# EasyEDA Pro project climbsnail-spotwelder-45c7d2f7.epro, board 大号控制板（部分未绘制）
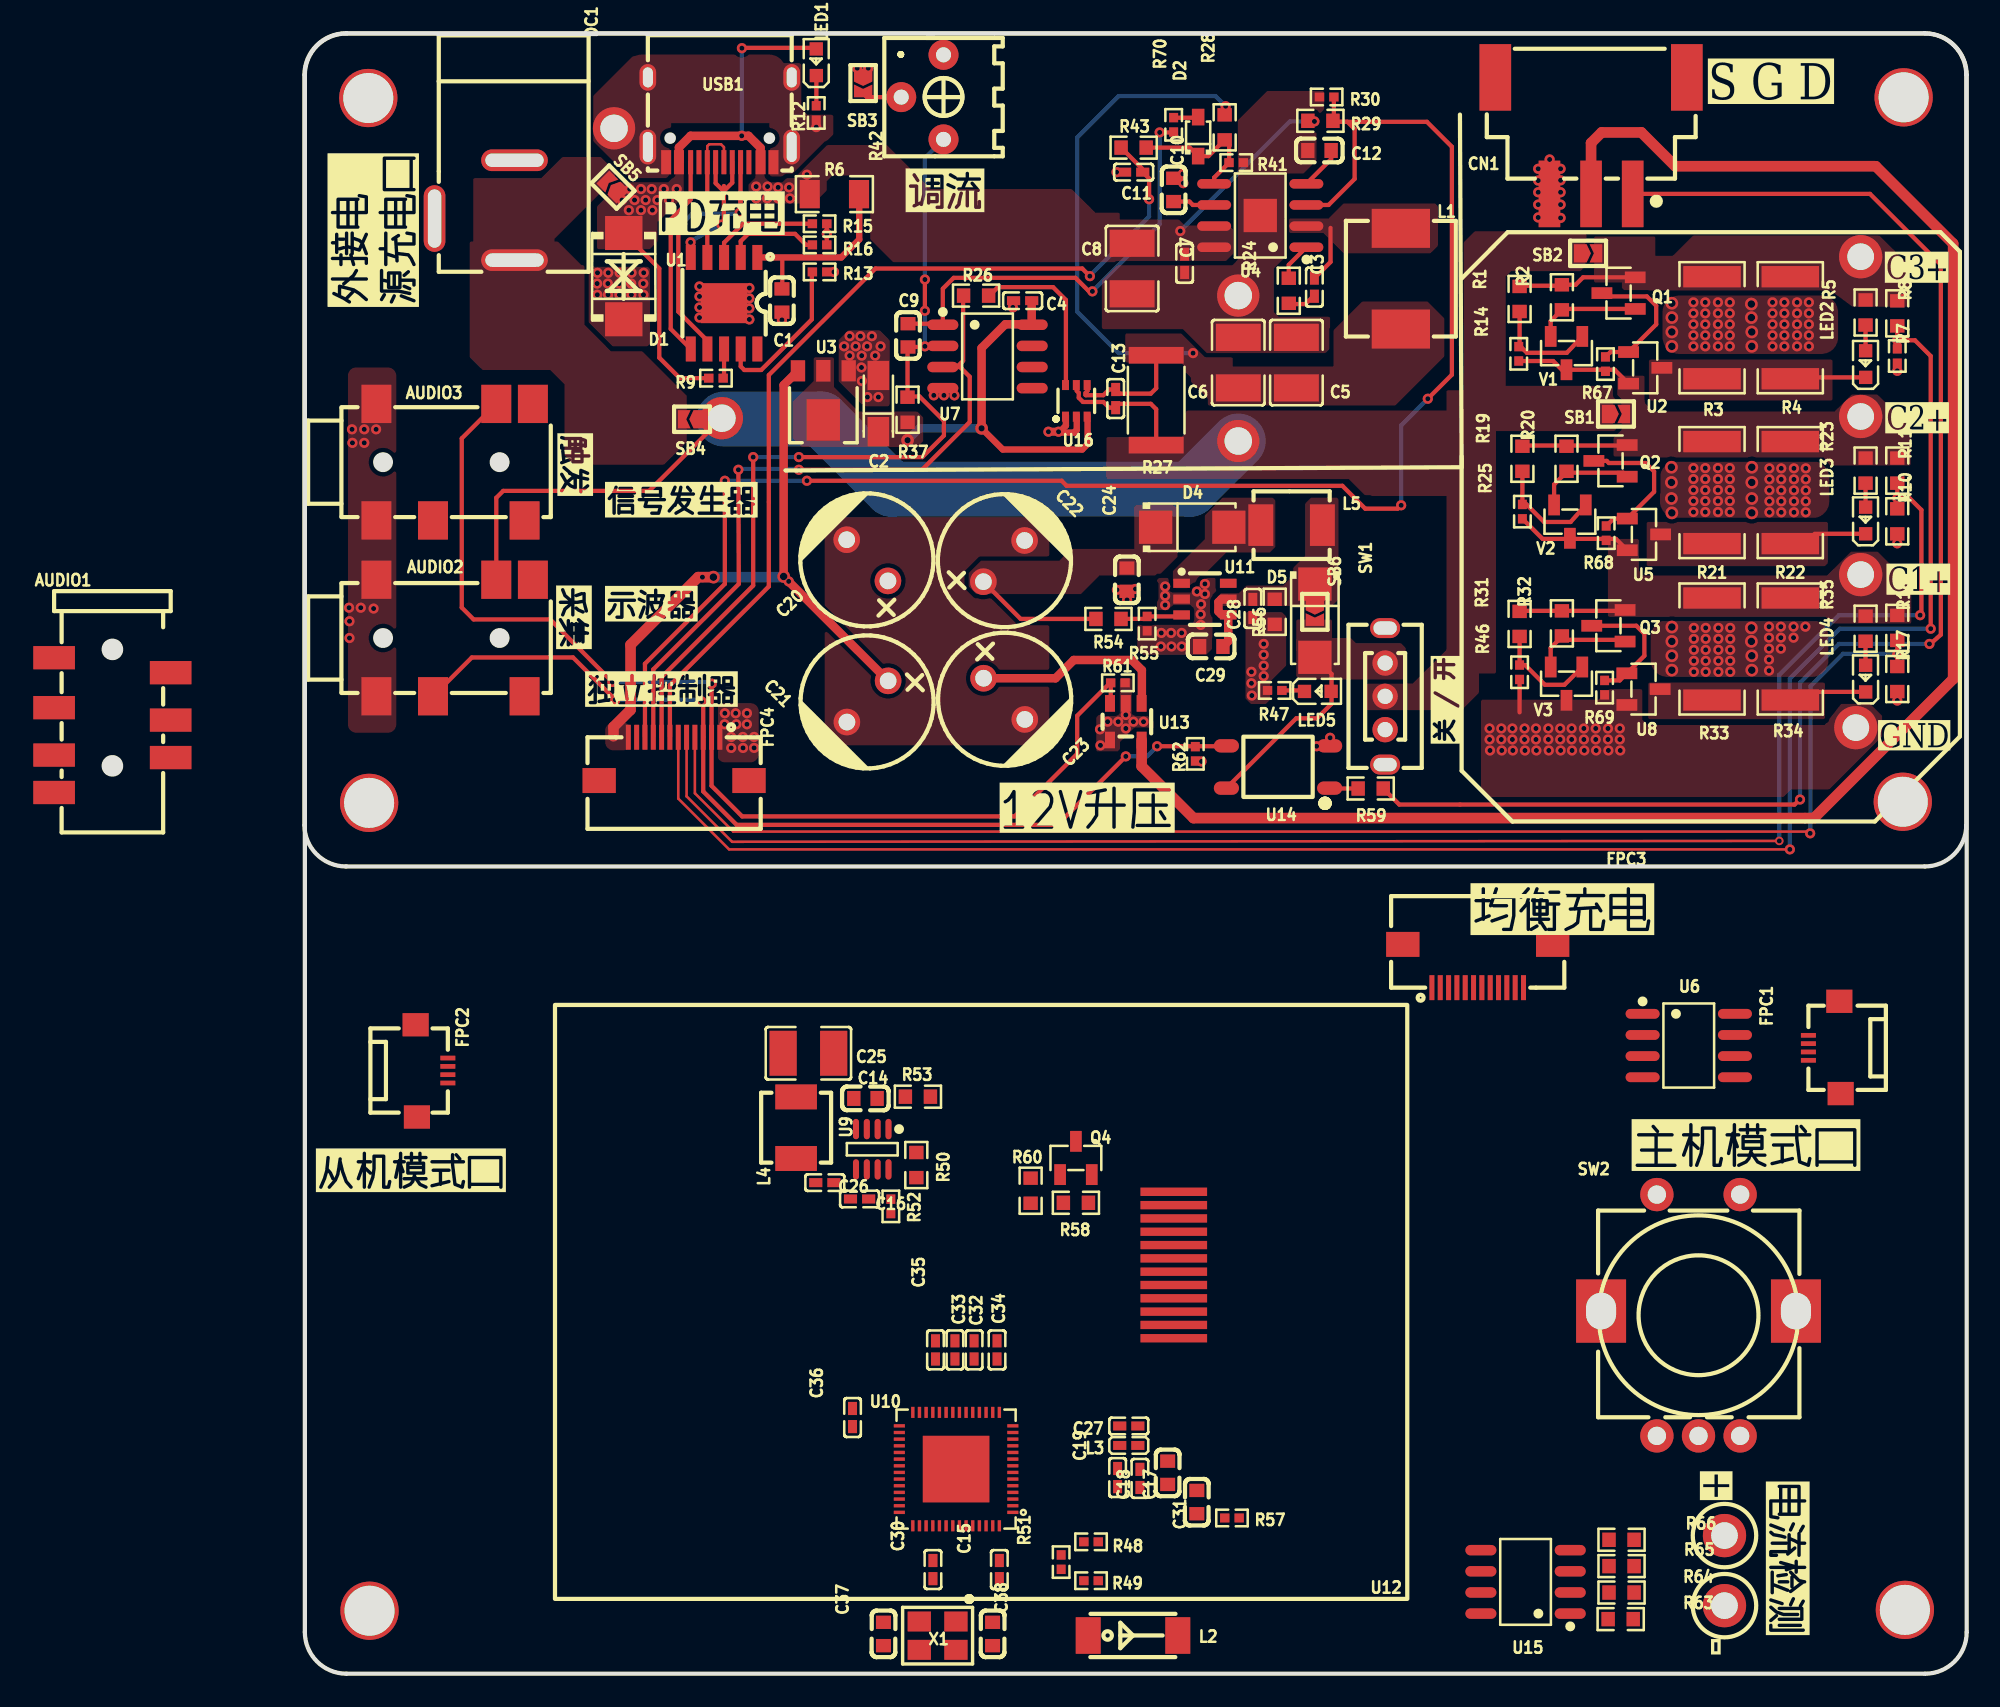
[diagram p16: board, top side]
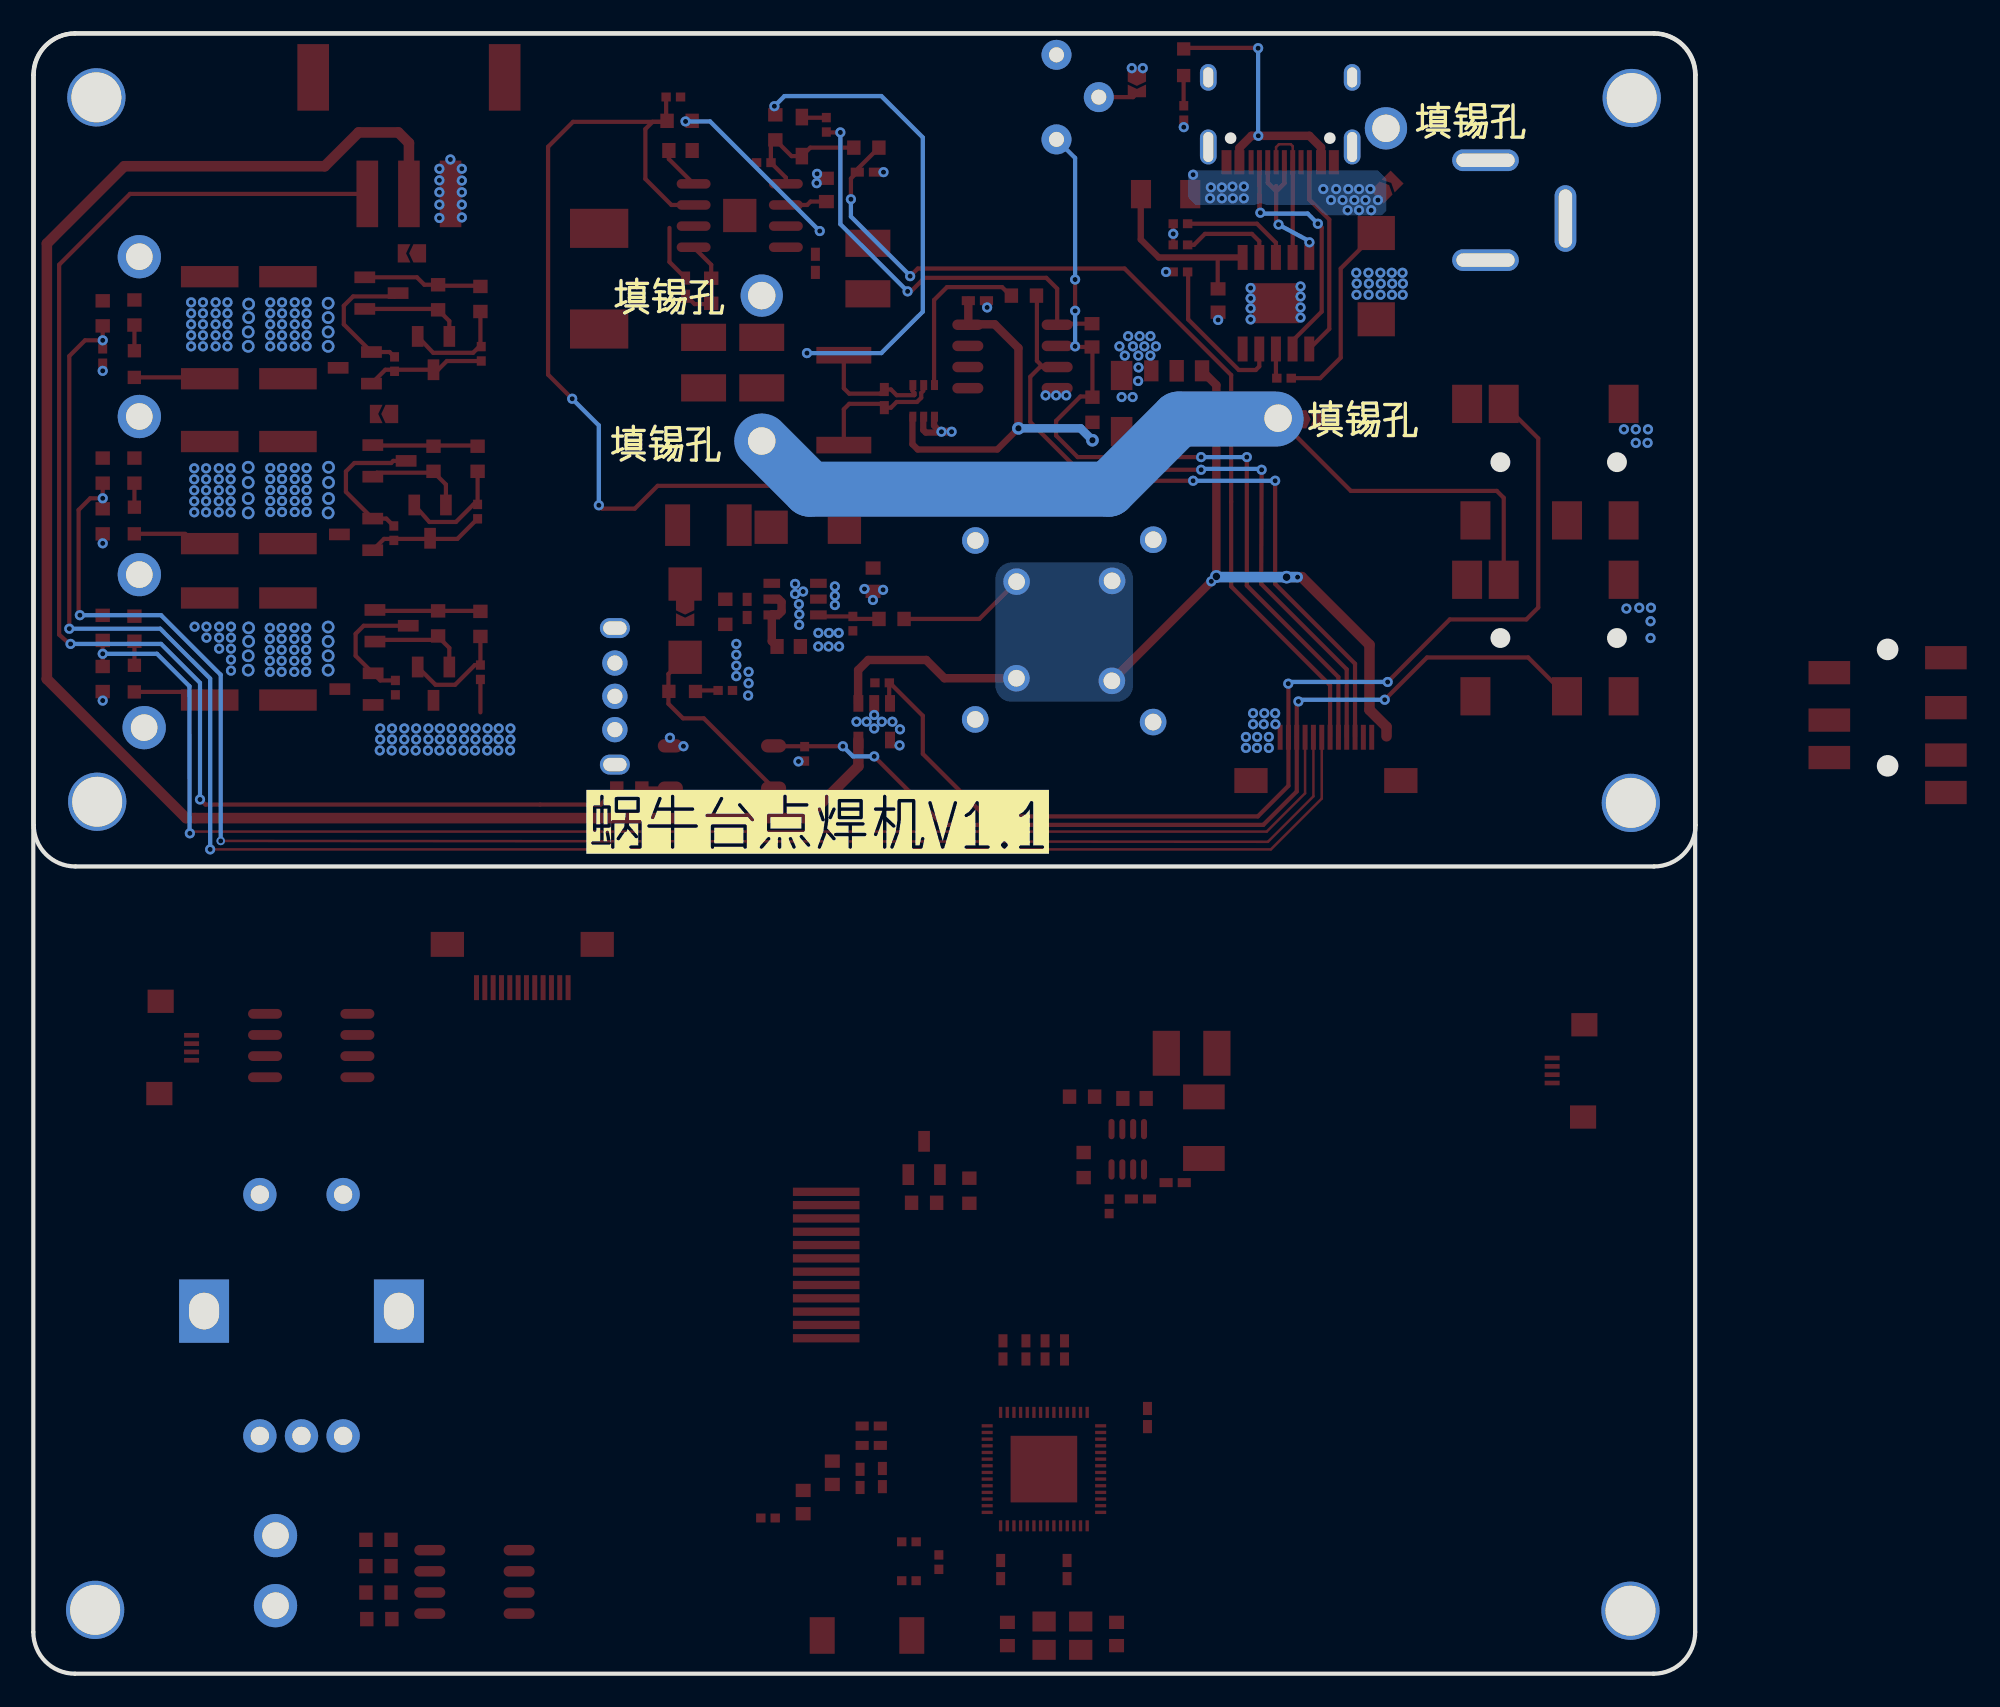
[diagram p17: board, bottom side, seen from below]

Outline 112 x 98.56 mm; copper layers: Top Layer, Bottom Layer. Coordinates in mm from the lower left corner of the outline.
Outline path: 12.18,96.06 12.18,51 arc(12.91,49.24) 14.68,48.5 109.48,48.5 arc(111.25,49.24) 111.98,51 111.98,96.06 arc(111.25,97.83) 109.48,98.56 14.68,98.56 arc(12.91,97.83) 12.18,96.06 ; 12.2,96.05 12.2,2.5 arc(12.94,0.73) 14.7,0 109.5,0 arc(111.27,0.73) 112,2.5 112,96.05 arc(111.27,97.82) 109.5,98.55 14.7,98.55 arc(12.94,97.82) 12.2,96.05
Stack: Top Layer 0.035mm / Dielectric1 1.51mm FR4 er 4.5 / Bottom Layer 0.035mm

## Design rules (mm)
net +CAP: DP1
net $1N37952: DP1
spacing copperThickness1oz (default): track to track 0.102, other pairs 0.152 to 0.3
spacing copperThickness2oz: track to track 0.203, other pairs 0.152 to 0.3
spacing Plane_innerPlane: track to track 0.102, other pairs 0.152 to 0.3
spacing Copper_copperRegion: track to track 0.102, other pairs 0.152 to 0.3
track width copperThickness1oz (default): min 0.127, default 0.254, max 2.54
track width copperThickness2oz: min 0.203, default 0.254, max 2.54
differential pair differentialPair (default): width min 0.127, default 0.254, max 2.54; gap min 0.152, default 0.152
pour e544 uses Copper_copperRegion
pour e546 uses Copper_copperRegion
pour e548 uses Copper_copperRegion
pour e550 uses Copper_copperRegion
pour e552 uses Copper_copperRegion
pour e554 uses Copper_copperRegion
pour e556 uses Copper_copperRegion
pour e558 uses Copper_copperRegion
pour e560 uses Copper_copperRegion
pour e562 uses Copper_copperRegion
pour e564 uses Copper_copperRegion
pour e566 uses Copper_copperRegion
pour e568 uses Copper_copperRegion
pour e570 uses Copper_copperRegion
pour e572 uses Copper_copperRegion
pour e574 uses Copper_copperRegion
pour e576 uses Copper_copperRegion
pour e578 uses Copper_copperRegion
pour e580 uses Copper_copperRegion
pour e582 uses Copper_copperRegion
pour e584 uses Copper_copperRegion
pour e586 uses Copper_copperRegion
pour e588 uses Copper_copperRegion
pour e590 uses Copper_copperRegion
pour e592 uses Copper_copperRegion
pour e594 uses Copper_copperRegion
pour e596 uses Copper_copperRegion
pour e598 uses Copper_copperRegion
pour e600 uses Copper_copperRegion
pour e602 uses Copper_copperRegion
pour e604 uses Copper_copperRegion
pour e606 uses Copper_copperRegion
pour e608 uses Copper_copperRegion
pour e610 uses Copper_copperRegion
pour e612 uses Copper_copperRegion
pour e614 uses Copper_copperRegion
pour e616 uses Copper_copperRegion
pour e618 uses Copper_copperRegion
pour e620 uses Copper_copperRegion
pour e622 uses Copper_copperRegion
pour e623 uses Copper_copperRegion
pour e625 uses Copper_copperRegion
pour e627 uses Copper_copperRegion
pour e629 uses Copper_copperRegion
pour e631 uses Copper_copperRegion
pour e633 uses Copper_copperRegion
pour e635 uses Copper_copperRegion
pour e637 uses Copper_copperRegion

## Placement (name value [footprint] x y rotation side)
AUDIO1  PJ-393-7A  [AUDIO-SMD_PJ-393-7A]  0.65 57 0 top
AUDIO2  PJ-342  [AUDIO-SMD_PJ-3420-A-SMT_C319102]  21.2 62.23 0 top
AUDIO3  PJ-342  [AUDIO-SMD_PJ-3420-A-SMT_C319102]  21.2 72.8 0 top
C1  1uF  [C0603]  40.86 82.51 90 top
C2  10uF  [CAP-SMD-钽_3216]  46.65 76.32 90 top
C3  100nF  [C0402]  72.83 83.31 270 top
C4  100nF  [C0402]  55.31 82.5 180 top
C5  22uF/25V  [C1210]  71.75 78.78 90 top
C6  22uF/25V  [C1210]  68.26 78.78 90 top
C7  100nF  [C0402]  65.04 84.74 90 top
C8  22uF/25V  [C1210]  61.88 84.43 270 top
C9  1uF  [C0603]  48.43 80.42 90 top
C10  1uF  [C0603]  64.38 89.15 270 top
C11  100nF  [C0402]  61.98 90.22 180 top
C12  1uF  [C0603]  73.14 91.52 0 top
C13  100nF  [C0402]  60.9 76.62 90 top
C14  1uF  [C0603]  45.87 34.57 0 top
C15  100nF  [C0402]  53.91 6.26 270 top
C16  100nF  [C0402]  45.52 28.53 180 top
C17  1uF  [C0603]  64.02 12.07 90 top
C18  100nF  [C0402]  62.35 11.73 90 top
C19  100nF  [C0402]  61.01 11.79 90 top
C20  16V470uF  [CAP-TH_BD8.0-P3.50-D0.6-FD_1]  45.98 66.9 135 top
C21  16V470uF  [CAP-TH_BD8.0-P3.50-D0.6-FD_1]  45.99 58.42 225 top
C22  16V470uF  [CAP-TH_BD8.0-P3.50-D0.6-FD_1]  54.19 66.85 45 top
C23  16V470uF  [CAP-TH_BD8.0-P3.50-D0.6-FD_1]  54.2 58.58 315 top
C24  1uF  [C0603]  61.57 65.73 90 top
C25  22uF/25V  [C1210]  42.44 37.28 0 top
C26  100nF  [C0402]  43.43 29.51 180 top
C27  100nF  [C0402]  61.68 14.88 0 top
C28  100nF  [C0402]  69.13 64.01 90 top
C29  1uF  [C0603]  66.64 61.72 0 top
C30  100nF  [C0402]  49.92 6.26 90 top
C31  1uF  [C0603]  65.77 10.31 90 top
C32  100nF  [C0402]  52.39 19.46 90 top
C33  100nF  [C0402]  51.24 19.46 90 top
C34  100nF  [C0402]  53.77 19.46 90 top
C35  100nF  [C0402]  50.08 19.46 270 top
C36  100nF  [C0402]  45.09 15.39 270 top
C37  22pF  [C0603]  46.95 2.39 270 top
C38  22pF  [C0603]  53.5 2.39 270 top
CN1  XH2.54-3P  [CONN-SMD_3P-P2.50-WT]  89.45 92.41 180 top
CN2  5006  [TH_BD3.2-D2.0]  97.46 4.09 90 top
CN3  5006  [TH_BD3.2-D2.0]  97.46 8.3 90 top
D1  SMBJ20CA  [SMB_L4.6-W3.6-LS5.3-BI]  31.36 83.97 270 top
D2  1N4148WS  [SOD-323_L1.8-W1.3-LS2.5-RD]  65.85 92.36 90 top
D4  SS34  [SMA_L4.3-W2.6-LS5.2-RD]  65.49 68.88 0 top
D5  NC/SS34  [SMA_L4.3-W2.6-LS5.2-RD]  72.86 63.27 270 top
DC1  DC-005 2.0  [DC-IN-TH_DC-5520-1]  22.39 87.93 270 top
FPC1  X05A12H04G  [FPC-SMD_4P-P0.50_XKB_X05A12H04G]  103.47 37.63 90 top
FPC2  X05A12H04G  [FPC-SMD_4P-P0.50_XKB_X05A12H04G]  19.82 36.22 270 top
FPC3  XW05200-12  [FPC-SMD_12P-P0.50_XW05200-12]  82.64 42.52 180 top
FPC4  XW05200-12  [FPC-SMD_12P-P0.50_XW05200-12]  34.38 54.97 0 top
L1  4.7uH  [IND-SMD_L7.0-W6.6_MCW-0650-220]  78.02 83.82 90 top
L2  AN2051-245  [ANT2051]  61.94 2.3 0 top
L3  2nH  [L0402]  61.68 13.72 180 top
L4  2.2uH  [IND-SMD_L4.2-W4.2-C133189]  41.71 32.81 270 top
L5  4.7uH  [IND-SMD_L4.5-W4.0-1]  71.46 69.01 180 top
LED1  -  [LED_0603]  42.91 96.88 90 top
LED2  -  [LED_0603]  105.93 78.74 90 top
LED3  -  [LED_0603]  105.93 69.34 90 top
LED4  -  [LED_0603]  105.93 59.84 90 top
LED5  -  [LED_0603]  73.09 59.03 0 top
NOREF  -  [Pad_e378]  30.77 92.85 0 top
NOREF#2  -  [Pad_e367]  108.29 3.84 0 top
NOREF#3  -  [Pad_e366]  16.01 94.67 0 top
NOREF#4  -  [Pad_e377]  68.26 82.8 0 top
NOREF#5  -  [Pad_e368]  108.22 94.72 0 top
NOREF#6  -  [Pad_e365]  16.09 3.78 0 top
NOREF#7  -  [Pad_e376]  37.25 75.44 0 top
NOREF#8  -  [Pad_e371]  105.64 75.54 0 top
NOREF#9  -  [Pad_e370]  105.64 85.14 0 top
NOREF#10  -  [Pad_e375]  68.26 74.07 0 top
NOREF#11  -  [Pad_e372]  105.64 66.04 0 top
NOREF#12  -  [Pad_e373]  105.35 56.84 0 top
NOREF#13  -  [Pad_e369]  16.06 52.32 90 top
NOREF#14  -  [Pad_e374]  108.17 52.39 180 top
Q1  SS8550  [SOT-23-3_L2.9-W1.3-P1.90-LS2.4-BR]  91.1 82.95 0 top
Q2  SS8550  [SOT-23-3_L2.9-W1.3-P1.90-LS2.4-BR]  90.61 72.87 0 top
Q3  SS8550  [SOT-23-3_L2.9-W1.3-P1.90-LS2.4-BR]  90.49 62.97 0 top
Q4  S8050  [SOT-23-3_L2.9-W1.3-P1.90-LS2.4-BR]  58.51 30.99 270 top
R1  500R  [R0603]  85.15 82.6 90 top
R2  200R  [R0603]  87.69 82.7 90 top
R3  10Ω  [R2512]  96.71 80.87 90 top
R4  10Ω  [R2512]  101.41 80.87 90 top
R5  1K  [R0603]  105.93 81.79 90 top
R6  1K  [R1206]  44 88.9 0 top
R7  10K  [R0402]  107.83 79.17 90 top
R8  100K  [R0603]  107.83 81.74 270 top
R9  10K  [R0402]  36.89 77.84 180 top
R10  100K  [R0603]  107.83 69.24 270 top
R11  200K  [R0603]  107.83 72.29 270 top
R12  10K  [R0402]  42.91 93.78 90 top
R13  NC/10K  [R0402]  43.12 84.23 0 top
R14  10K  [R0402]  85.1 79.31 90 top
R15  NC/10K  [R0402]  43.12 87.12 180 top
R16  NC/10K  [R0402]  43.12 85.85 0 top
R17  100K  [R0603]  107.83 59.77 270 top
R18  100K  [R0603]  107.83 62.84 270 top
R19  500R  [R0603]  85.32 73 90 top
R20  200R  [R0603]  87.97 73 90 top
R21  10Ω  [R2512]  96.71 70.97 90 top
R22  10Ω  [R2512]  101.41 70.97 90 top
R23  1K  [R0603]  105.93 72.29 90 top
R24  10R  [R0603]  71.29 83.09 90 top
R25  10K  [R0402]  85.32 69.82 90 top
R26  1K  [R0603]  52.51 82.8 180 top
R27  10mΩ  [R2512#2]  63.33 76.52 270 top
R28  78.7K  [R0603]  67.44 92.91 90 top
R29  100K  [R0603]  73.19 93.3 0 top
R30  10K  [R0402]  73.57 94.74 0 top
R31  500R  [R0603]  85.15 63.08 90 top
R32  200R  [R0603]  87.69 63.11 90 top
R33  10Ω  [R2512]  96.71 61.57 90 top
R34  10Ω  [R2512]  101.41 61.57 90 top
R35  1K  [R0603]  105.93 62.79 90 top
R37  100K  [R0603]  48.4 75.95 90 top
R41  10K  [R0402]  68.13 90.79 180 top
R42  200kΩ  [RES-ADJ-TH_3P-L7.1-W6.9-P2.50-L_3362P]  49.29 94.73 90 top
R43  NC  [R0603]  61.98 91.69 0 top
R46  10K  [R0402]  85.15 60.17 90 top
R47  10K  [R0402]  70.45 59.08 180 top
R48  TBD  [R0402]  59.42 7.92 180 top
R49  TBD  [R0402]  59.42 5.59 180 top
R50  8.87K  [R0603]  48.92 30.56 270 top
R51  0R  [R0402]  57.62 6.71 270 top
R52  40.2K  [R0402]  47.4 28.08 90 top
R53  200K  [R0603]  49.02 34.67 0 top
R54  200K  [R0603]  60.46 63.38 180 top
R55  10K  [R0402]  62.79 63.09 90 top
R56  200K  [R0603]  70.45 63.8 90 top
R57  10K  [R0402]  67.88 9.36 0 top
R58  10R  [R0603]  58.51 28.3 0 top
R59  1K  [R0603]  76.21 53.19 180 top
R60  1K  [R0603]  55.79 29.02 270 top
R61  10K  [R0402]  61.03 59.54 180 top
R62  10K  [R0402]  65.68 55.27 90 top
R63  2K  [R0603]  91.22 3.28 180 top
R64  1K  [R0603]  91.27 4.88 0 top
R65  2K  [R0603]  91.27 6.47 180 top
R66  1K  [R0603]  91.27 8.05 180 top
R67  10K  [R0402]  90.31 78.69 90 top
R68  10K  [R0402]  90.35 68.53 90 top
R69  10K  [R0402]  90.26 59.25 90 top
R70  10K  [R0402]  64.38 93.07 90 top
SB1  短路点小型  [短路点]  91.13 75.69 180 top
SB2  短路点小型  [短路点]  89.46 85.34 180 top
SB3  短路点小型  [短路点]  45.73 95.38 90 top
SB4  短路点小型  [短路点]  35.27 75.37 0 top
SB5  短路点小型  [短路点]  30.57 89.46 315 top
SB6  短路点小型  [短路点]  72.86 63.61 90 top
SW1  SS-12D07-4  [SW-TH_3P-L8.6-W4.5-P2.60]  77.08 58.72 90 top
SW2  EC11S  [SW-TH_EC11S]  95.9 21.54 0 top
U1  -  [ESOP-10_L4.9-W3.9-P1.00-LS6.2-BL-EP]  37.38 82.35 180 top
U2  AO3400  [SOT-23-3_L2.9-W1.3-P1.90-LS2.4-BL-2]  92.7 78.46 270 top
U3  -  [SOT89L]  43.34 76.81 180 top
U4  SY8205FCC  [SOIC-8_L5.0-W4.0-P1.27-LS6.0-BL-EP2.0]  69.58 87.62 90 top
U5  AO3400  [SOT-23-3_L2.9-W1.3-P1.90-LS2.4-BL-2]  92.62 68.45 270 top
U6  π122U31  [SOIC-8_L4.9-W3.9-P1.27-LS6.0-BL]  95.31 37.74 270 top
U7  GS8632-SR / GS8332-SR  [SOP-8_L4.9-W3.9-P1.27-LS6.0-BL]  53.2 79.15 270 top
U8  AO3400  [SOT-23-3_L2.9-W1.3-P1.90-LS2.4-BL-2]  92.59 59.16 270 top
U9  -  [TSOT-23-8_L2.9-W1.6-P0.65-LS2.8-BR]  46.28 31.51 90 top
U10  ESP32-S3FH4R2  [QFN-56_L7.0-W7.0-P0.40-TL-EP4.0]  51.31 12.29 180 top
U11  SX1308  [SOT-23-6_L2.9-W1.6-P0.95-LS2.8-BR]  66.26 64.57 180 top
U12  -  [2.0TFT-FPC12P]  78.41 4.37 90 top
U13  UCC27517DBVT  [SOT-23-5_L2.9-W1.6-P0.95-LS2.8-BR]  61.51 57.2 90 top
U14  CT185GB(T1)  [SOP-4_L4.4-W3.6-P2.54-LS7.0-TL]  70.65 54.48 180 top
U15  GS8332-SR  [SOP-8_L4.9-W3.9-P1.27-LS6.0-BL]  85.51 5.52 90 top
U16  INA199A1DCKR  [SC-70-6_L2.2-W1.3-P0.65-LS2.1-BR]  58.53 76.48 270 top
USB1  TYPEC-304-BCP16  [USB-C-SMD_TYPEC-304-BCP16]  37.12 93.37 180 top
V1  -  [SOT-23-3_L2.9-W1.3-P1.90-LS2.4-BR]  87.97 79.35 90 top
V2  -  [SOT-23-3_L2.9-W1.3-P1.90-LS2.4-BR]  88.18 69.22 90 top
V3  -  [SOT-23-3_L2.9-W1.3-P1.90-LS2.4-BR]  87.97 59.49 90 top
X1  40MHz  [OSC-SMD_4P-L3.2-W2.5-BL_SIT8008BI]  50.2 2.29 180 top

## Footprints (pads in the part's own frame, mm; a bottom-side part is the same pattern mirrored in y, then rotated)
2.0TFT-FPC12P
  rect 0.5x4 smd: 1(24.587,14.021) 2(23.787,14.021) 3(22.987,14.021) 4(22.187,14.021) 5(21.387,14.021) 6(20.587,14.021) 7(19.787,14.021) 8(18.987,14.021) 9(18.187,14.021) 10(17.387,14.021) 11(16.587,14.021) 12(15.787,14.021)
ANT2051
  rect 1.5x2.2 smd: 1(-2.69,0) 2(2.69,0)
AUDIO-SMD_PJ-393-7A
  rect 2.499x1.399 smd: 1(-3.5,4.049) 2(3.5,-1.95) 3(-3.5,-1.801) 4(-3.5,1.049) 5(-3.5,-4.049) 6(3.5,0.299) 7(3.5,3.15)
AUDIO-SMD_PJ-3420-A-SMT_C319102
  rect 1.8x2.3 smd: 1(-4.7,-3.5) 2(-4.7,3.5) 3(-1.3,-3.5) 4(2.5,3.5) 5(4.7,3.5) 6(4.2,-3.5)
C0402
  rect 0.79x0.54 smd: 1(-0.545,0) 2(0.545,0)
C0603
  rect 0.8x0.9 smd: 1(-0.7,0) 2(0.7,0)
C1210
  rect 1.635x2.7 smd: 1(-1.518,0) 2(1.518,0)
CAP-SMD-钽_3216
  rect 1.758x1.296 smd: 1(-1.687,0) 2(1.687,0)
CAP-TH_BD8.0-P3.50-D0.6-FD_1
  round 1.6 hole 1: 1(-1.75,0) 2(1.75,0)
CONN-SMD_3P-P2.50-WT
  rect 1.3x4 smd: 1(-2.499,3.5) 2(0,3.5) 3(2.499,3.5)
  rect 1.9x4 smd: 4(-5.75,-3.5) 5(5.75,-3.5)
DC-IN-TH_DC-5520-1
  oval 4x1.3 hole 3.5x0.8: 2(0.5,-2.4)
  oval 1.3x4 hole 0.8x3.5: 3(-3,2.4) 4(3,2.4)
ESOP-10_L4.9-W3.9-P1.00-LS6.2-BL-EP
  rect 0.6x1.5 smd: 1(-2,-2.75) 2(-1,-2.75) 3(0,-2.75) 4(1,-2.75) 5(2,-2.75) 6(2,2.75) 7(1,2.75) 8(0,2.75) 9(-1,2.75) 10(-2,2.75)
  rect 2.8x2.4 smd: 11(0,0)
FPC-SMD_4P-P0.50_XKB_X05A12H04G
  rect 0.28x0.9 smd: 1(-0.772,0.968) 2(-0.272,0.968) 3(0.228,0.968) 4(0.728,0.968)
  rect 1.4x1.57 smd: 5(-2.772,-0.968) 6(2.772,-0.889)
FPC-SMD_12P-P0.50_XW05200-12
  rect 0.3x1.5 smd: 1(2.75,1.3) 2(2.25,1.3) 3(1.75,1.3) 4(1.25,1.3) 5(0.75,1.3) 6(0.25,1.3) 7(-0.25,1.3) 8(-0.75,1.3) 9(-1.25,1.3) 10(-1.75,1.3) 11(-2.25,1.3) 12(-2.75,1.3)
  rect 2x1.5 smd: 13(-4.5,-1.3) 14(4.5,-1.3)
IND-SMD_L4.2-W4.2-C133189
  rect 1.5x2.5 smd: 1(-1.85,0) 2(1.85,0)
IND-SMD_L4.5-W4.0-1
  rect 1.501x2.499 smd: 1(-1.849,0) 2(1.849,0)
IND-SMD_L7.0-W6.6_MCW-0650-220
  rect 2.349x3.5 smd: 1(-3.025,0) 2(3.025,0)
L0402
  rect 0.79x0.54 smd: 1(-0.545,0) 2(0.545,0)
LED_0603
  rect 0.8x0.8 smd: 1(-0.851,-0.01) 2(0.75,-0.005)
OSC-SMD_4P-L3.2-W2.5-BL_SIT8008BI
  rect 1.399x1.199 smd: 1(-1.1,-0.851) 2(1.1,-0.851) 3(1.1,0.851) 4(-1.1,0.851)
Pad_e365
  round 3.5 hole 3: 1(0,0)
Pad_e366
  round 3.5 hole 3: 1(0,0)
Pad_e367
  round 3.5 hole 3: 1(0,0)
Pad_e368
  round 3.5 hole 3: 1(0,0)
Pad_e369
  round 3.5 hole 3: 1(0,0)
Pad_e370
  round 2.6 hole 1.6: 1(0,0)
Pad_e371
  round 2.6 hole 1.6: 1(0,0)
Pad_e372
  round 2.6 hole 1.6: 1(0,0)
Pad_e373
  round 2.6 hole 1.6: 1(0,0)
Pad_e374
  round 3.5 hole 3: 1(0,0)
Pad_e375
  round 2.54 hole 1.651: 14(0,0)
Pad_e376
  round 2.54 hole 1.651: 14(0,0)
Pad_e377
  round 2.54 hole 1.651: 14(0,0)
Pad_e378
  round 2.54 hole 1.651: 14(0,0)
QFN-56_L7.0-W7.0-P0.40-TL-EP4.0
  rect 0.665x0.2 smd: 1(-3.408,2.6) 2(-3.408,2.2) 3(-3.408,1.8) 4(-3.408,1.4) 5(-3.408,1) 6(-3.408,0.6) 7(-3.408,0.2) 8(-3.408,-0.2) 9(-3.408,-0.6) 10(-3.408,-1) 11(-3.408,-1.4) 12(-3.408,-1.8) 13(-3.408,-2.2) 14(-3.408,-2.6) 29(3.408,-2.6) 30(3.408,-2.2) 31(3.408,-1.8) 32(3.408,-1.4) 33(3.408,-1) 34(3.408,-0.6) 35(3.408,-0.2) 36(3.408,0.2) 37(3.408,0.6) 38(3.408,1) 39(3.408,1.4) 40(3.408,1.8) 41(3.408,2.2) 42(3.408,2.6)
  rect 0.2x0.665 smd: 15(-2.6,-3.408) 16(-2.2,-3.408) 17(-1.8,-3.408) 18(-1.4,-3.408) 19(-1,-3.408) 20(-0.6,-3.408) 21(-0.2,-3.408) 22(0.2,-3.408) 23(0.6,-3.408) 24(1,-3.408) 25(1.4,-3.408) 26(1.8,-3.408) 27(2.2,-3.408) 28(2.6,-3.408) 43(2.6,3.408) 44(2.2,3.408) 45(1.8,3.408) 46(1.4,3.408) 47(1,3.408) 48(0.6,3.408) 49(0.2,3.408) 50(-0.2,3.408) 51(-0.6,3.408) 52(-1,3.408) 53(-1.4,3.408) 54(-1.8,3.408) 55(-2.2,3.408) 56(-2.6,3.408)
  rect 4x4 smd: 57(0,0)
R0402
  rect 0.566x0.54 smd: 1(-0.433,0) 2(0.433,0)
R0603
  rect 0.806x0.864 smd: 1(-0.753,0) 2(0.753,0)
R1206
  rect 1.208x1.701 smd: 1(-1.479,0) 2(1.479,0)
R2512
  rect 1.282x3.456 smd: 1(-3.067,0) 2(3.067,0)
R2512#2
  rect 1x3.3 smd: 1(-2.7,0) 2(2.7,0)
RES-ADJ-TH_3P-L7.1-W6.9-P2.50-L_3362P
  round 1.801 hole 0.899: 1(-2.54,-1.27) 2(0,1.27) 3(2.54,-1.27)
SC-70-6_L2.2-W1.3-P0.65-LS2.1-BR
  rect 0.6x0.42 smd: 1(0.95,-0.65) 2(0.95,0) 3(0.95,0.65) 4(-0.95,0.65) 5(-0.95,0) 6(-0.95,-0.65)
SMA_L4.3-W2.6-LS5.2-RD
  rect 2x2 smd: 1(-2.2,0) 2(2.2,0)
SMB_L4.6-W3.6-LS5.3-BI
  rect 2.047x2.241 smd: 1(-2.591,0) 2(2.591,0)
SOD-323_L1.8-W1.3-LS2.5-RD
  rect 1x0.75 smd: 1(-1.173,0) 2(1.173,0)
SOIC-8_L4.9-W3.9-P1.27-LS6.0-BL
  oval 0.588x2.045 smd: 1(-1.905,-2.772) 2(-0.635,-2.772) 3(0.635,-2.772) 4(1.905,-2.772) 5(1.905,2.772) 6(0.635,2.772) 7(-0.635,2.772) 8(-1.905,2.772)
SOIC-8_L5.0-W4.0-P1.27-LS6.0-BL-EP2.0
  oval 0.574x2.038 smd: 1(-1.905,-2.769) 2(-0.635,-2.769) 3(0.635,-2.769) 4(1.905,-2.769) 5(1.905,2.769) 6(0.635,2.769) 7(-0.635,2.769) 8(-1.905,2.769)
  rect 2x2 smd: 9(0,0)
SOP-4_L4.4-W3.6-P2.54-LS7.0-TL
  oval 1.508x0.8 smd: 1(-3.1,1.27) 2(-3.1,-1.27) 3(3.1,-1.27) 4(3.1,1.27)
SOP-8_L4.9-W3.9-P1.27-LS6.0-BL
  oval 0.63x1.865 smd: 1(-1.905,-2.683) 2(-0.635,-2.683) 3(0.635,-2.683) 4(1.905,-2.683) 5(1.905,2.683) 6(0.635,2.683) 7(-0.635,2.683) 8(-1.905,2.683)
SOT89L
  rect 0.864x1.27 smd: 1(-1.524,-1.475) 3(1.524,-1.475)
  rect 0.864x1.3 smd: 2(0,-1.475)
  rect 2x2.5 smd: 4(0.001,1.475)
SOT-23-3_L2.9-W1.3-P1.90-LS2.4-BL-2
  rect 0.7x1.25 smd: 1(-0.95,-1) 2(0.95,-1) 3(0,1)
SOT-23-3_L2.9-W1.3-P1.90-LS2.4-BR
  rect 1.25x0.7 smd: 1(1,-0.95) 2(1,0.95) 3(-1,0)
SOT-23-5_L2.9-W1.6-P0.95-LS2.8-BR
  rect 1.001x0.6 smd: 1(1.1,-0.95) 2(1.1,0) 3(1.1,0.95) 4(-1.1,0.95) 5(-1.1,-0.95)
SOT-23-6_L2.9-W1.6-P0.95-LS2.8-BR
  rect 1x0.55 smd: 1(1.4,-0.95) 2(1.4,0) 3(1.4,0.95) 4(-1.4,0.95) 5(-1.4,0) 6(-1.4,-0.95)
SW-TH_3P-L8.6-W4.5-P2.60
  round 1.524 hole 0.914: 1(-2,0) 2(0,0) 3(2,0)
  oval 1.2x1.8 hole 0.8x1.4: 4(-4.1,0) 5(4.1,0)
SW-TH_EC11S
  rect 3x3.8 hole 1.8x2.2: 0(-5.85,0.25) 0(5.85,0.25)
  round 2 hole 1.1: A(-2.5,-7.25) B(2.5,-7.25) C(0,-7.25) S1(-2.5,7.25) S2(2.5,7.25)
TH_BD3.2-D2.0
  round 2.6 hole 1.6: 1(0,0)
TSOT-23-8_L2.9-W1.6-P0.65-LS2.8-BR
  oval 1.222x0.363 smd: 1(1.212,-0.976) 2(1.212,-0.325) 3(1.212,0.325) 4(1.212,0.976) 5(-1.212,0.976) 6(-1.212,0.325) 7(-1.212,-0.325) 8(-1.212,-0.976)
USB-C-SMD_TYPEC-304-BCP16
  oval 1.001x2.1 hole 0.6x1.801: 13(-4.321,1.633) 14(4.321,1.633)
  oval 1.001x1.6 hole 0.6x1.199: 15(-4.321,-2.547) 16(4.321,-2.547)
  rect 0.6x1.45 smd: A1B12(-3.226,2.547) A4B9(-2.451,2.547) B1A12(3.22,2.547) B4A9(2.451,2.547)
  rect 0.299x1.45 smd: A5(-1.25,2.547) A6(-0.249,2.547) A7(0.249,2.547) A8(1.25,2.547) B5(1.75,2.547) B6(0.75,2.547) B7(-0.75,2.547) B8(-1.75,2.547)
短路点
  custom 0x0 smd: 1(-0.66,0) 2(1.042,0)

## Nets
As in the schematic, except:
GND: AUDIO1.1 AUDIO2.1 AUDIO2.2 AUDIO3.1 AUDIO3.2 C1.1 C2.2 C4.2 C5.2 C6.2 C7.1 C8.2 C10.1 C11.2 C12.1 C14.1 C15.2 C16.2 C17.1 C18.1 C19.1 C20.2 C21.2 C22.2 C23.2 C24.1 C25.2 C27.1 C28.1 C29.1 C30.1 C31.2 C32.2 C33.2 C34.2 C35.1 C36.1 C37.1 C38.2 CN1.3 D1.2 DC1.3 FPC2.4 FPC3.12 FPC4.1 NOREF.14 NOREF#4.14 NOREF#12.1 Q4.2 R7.1 R10.2 R12.1 R13.2 R15.1 R16.2 R17.2 R30.1 R41.1 R46.1 R47.2 R48.1 R49.1 R50.1 R55.1 R56.1 R61.1 R62.1 R69.1 SB3.2 SW2.C SW2.S2 U1.11 U3.1 U4.9 U6.4 U7.4 U8.2 U9.1 U9.4 U10.57 U11.2 U12.1 U12.5 U12.6 U12.12 U13.2 U13.4 U14.2 U15.4 U16.1 U16.2 USB1.13 USB1.14 USB1.15 USB1.16 USB1.A1B12 USB1.B1A12 V3.3 X1.2 X1.4
+CAP: AUDIO1.2 AUDIO2.4 C13.1 NOREF#7.14 NOREF#10.14 R27.2 SB1.2 SB2.2 SB4.2 SW1.2 U16.5
CAP1: NOREF#11.1 Q3.2 R18.1 R25.1 R31.2 R32.2 R33.2 R34.2 R35.2 R68.1 U5.2 V2.3
CAP2: NOREF#8.1 Q2.2 R11.1 R14.1 R19.2 R20.2 R21.2 R22.2 R23.2 R67.1 SB1.1 U2.2 V1.3
CAP3: NOREF#9.1 Q1.2 R1.2 R2.2 R3.2 R4.2 R5.2 R8.1 SB2.1

Pads without a net: AUDIO1 5 6 7; AUDIO2 5 6; AUDIO3 3 5 6; CN1 4 5; DC1 2; FPC1 5 6; FPC2 5 6; FPC3 2 13 14; FPC4 11 13 14; L2 2; NOREF#2 1; NOREF#3 1; NOREF#5 1; NOREF#6 1; NOREF#13 1; NOREF#14 1; R42 3; SW1 1 4 5; SW2 0; U1 10; U7 5 6 7; U10 28 30 31 32 33 34 35 36 37 38 39 40 41 42 48; U11 6; U15 5 6 7; USB1 A8 B8

## Via types
v1: diameter 0.61, hole 0.305, Top Layer to Bottom Layer, 335 vias
v2: diameter 0.762, hole 0.457, Top Layer to Bottom Layer, 26 vias
v3: diameter 0.762, hole 0.381, Top Layer to Bottom Layer, 2 vias
v4: diameter 0.508, hole 0.305, Top Layer to Bottom Layer, 1 via

## Routing (per net, layer and track width the routed paths; a pad name or vN(x,y) marks a point on that pad's centre or on a via; arc(x,y) is an arc through that point)
3V3:
  vias: v3(48.4,74.11) v3(52.84,74.83)
+12V:
  vias: v1(36.08,65.89) v1(41.26,65.63) v2(36.74,65.89) v2(40.96,65.93)
GND:
  vias: v1(14.86,64.05) v1(14.88,63.24) v1(14.88,62.23) v1(15.04,74.77) v1(15.06,73.96) v1(15.56,64.05) v1(15.77,74.77) v1(15.77,73.96) v1(16.33,64) v1(16.48,74.77) v1(29.78,84.18) v1(29.76,83.53) v1(29.77,82.85) v1(30.4,83.53) v1(30.42,84.18) v1(30.41,82.85) v1(31.09,83.53) v1(31.1,82.85) v1(31.11,84.18) v1(31.8,83.53) v1(31.82,84.18) v1(31.81,82.85) v1(32.55,84.18) v1(32.53,83.53) v1(32.54,82.85) v1(35.9,83.35) v1(35.9,82.75) v1(35.9,82.09) v1(35.9,81.48) v1(37.43,57.71) v1(37.41,57.05) v1(37.81,56.29) v1(37.81,55.63) v1(38.08,57.71) v1(38.11,57.05) v1(38.51,56.29) v1(38.52,55.63) v1(38.75,57.71) v1(38.75,57.05) v1(38.9,83.26) v1(38.9,82.64) v1(38.9,82.04) v1(38.9,81.37) v1(39.18,56.29) v1(39.18,55.63) v1(40.85,81.34) v1(42.91,92.93) v1(43.55,86.51) v1(43.98,84.23) v1(44.59,79.76) v1(44.92,80.37) v1(44.92,79.2) v1(45.28,79.76) v1(45.38,96.47) v1(45.57,80.37) v1(45.64,79.2) v1(45.63,78.49) v1(45.66,77.67) v1(45.97,79.76) v1(45.99,76.71) v1(46.04,96.47) v1(46.25,80.37) v1(46.45,79.2) v1(46.65,76.71) v1(46.78,79.76) v1(49.97,76.81) v1(50.58,76.81) v1(51.21,76.81) v1(54.72,82.09) v1(56.86,74.62) v1(57.47,74.62) v1(59.96,56.74) v1(59.98,55.78) v1(60.41,57.2) v1(60.95,90.22) v1(60.97,65.13) v1(61.05,57.2) v1(61.58,64.52) v1(61.51,57.61) v1(61.51,56.79) v1(61.96,57.2) v1(62.09,65.18) v1(62.57,57.2) v1(63.64,62.53) v1(63.61,61.72) v1(63.87,65.33) v1(63.87,64.77) v1(63.87,64.21) v1(64.22,62.53) v1(64.24,61.72) v1(64.86,62.53) v1(64.86,61.72) v1(64.93,90.12) v1(64.96,89.56) v1(65.77,65.02) v1(66,63.65) v1(66.03,64.26) v1(66.01,63.02) v1(66.05,54.81) v1(66.26,65.48) v1(66.26,64.87) v1(69.05,60.2) v1(69.05,59.51) v1(69.07,58.78) v1(69.79,61.87) v1(69.79,61.23) v1(69.79,60.57) v1(69.79,59.94) v1(72.96,55.73) v1(73.77,56.24) v1(83.35,56.79) v1(83.35,56.13) v1(83.37,55.47) v1(84.06,56.79) v1(84.06,56.13) v1(84.08,55.47) v1(84.72,56.79) v1(84.72,56.13) v1(84.75,55.47) v1(85.45,56.79) v1(85.45,56.13) v1(85.47,55.47) v1(86.14,56.79) v1(86.14,56.13) v1(86.16,55.47) v1(86.27,90.42) v1(86.27,89.72) v1(86.27,89.01) v1(86.27,88.27) v1(86.27,87.5) v1(86.88,56.79) v1(86.88,56.13) v1(86.96,90.98) v1(86.91,55.47) v1(87.59,56.79) v1(87.59,56.13) v1(87.62,90.42) v1(87.62,89.73) v1(87.62,89.01) v1(87.62,88.27) v1(87.62,87.47) v1(87.62,55.47) v1(88.28,56.79) v1(88.28,56.13) v1(88.3,55.47) v1(89.01,56.79) v1(89.01,56.13) v1(89.04,55.47) v1(89.72,56.79) v1(89.72,56.13) v1(89.75,55.47) v1(90.46,56.79) v1(90.46,56.13) v1(90.49,55.47) v1(91.17,56.79) v1(91.17,56.13) v1(91.2,55.47) v1(95.59,82.4) v1(95.59,81.74) v1(95.59,81.08) v1(95.59,80.42) v1(95.59,79.76) v1(95.59,72.44) v1(95.59,71.78) v1(95.59,71.12) v1(95.59,70.46) v1(95.59,69.8) v1(95.62,62.84) v1(95.62,62.18) v1(95.62,61.52) v1(95.62,60.86) v1(95.62,60.2) v1(96.3,82.4) v1(96.3,81.74) v1(96.3,81.08) v1(96.3,80.42) v1(96.3,79.76) v1(96.3,72.44) v1(96.3,71.78) v1(96.3,71.12) v1(96.3,70.46) v1(96.3,69.8) v1(96.33,62.84) v1(96.33,62.18) v1(96.33,61.52) v1(96.33,60.86) v1(96.33,60.2) v1(97.07,82.4) v1(97.07,81.74) v1(97.07,81.08) v1(97.07,80.42) v1(97.07,79.76) v1(97.07,72.44) v1(97.07,71.78) v1(97.07,71.12) v1(97.07,70.46) v1(97.07,69.8) v1(97.09,62.84) v1(97.09,62.18) v1(97.09,61.52) v1(97.09,60.86) v1(97.09,60.2) v1(97.78,82.4) v1(97.78,81.74) v1(97.78,81.08) v1(97.78,80.42) v1(97.78,79.76) v1(97.78,72.44) v1(97.78,71.78) v1(97.78,71.12) v1(97.78,70.46) v1(97.78,69.8) v1(97.8,62.84) v1(97.8,62.18) v1(97.8,61.52) v1(97.8,60.86) v1(97.8,60.2) v1(100.15,72.42) v1(100.15,71.76) v1(100.15,71.1) v1(100.15,70.44) v1(100.15,69.78) v1(100.13,62.91) v1(100.13,62.25) v1(100.13,61.59) v1(100.13,60.93) v1(100.13,60.27) v1(100.34,82.4) v1(100.34,81.74) v1(100.34,81.08) v1(100.34,80.42) v1(100.34,79.76) v1(100.87,72.42) v1(100.87,71.76) v1(100.87,71.1) v1(100.87,70.44) v1(100.87,69.78) v1(100.84,62.91) v1(100.84,62.25) v1(100.84,61.59) v1(101.05,82.4) v1(101.05,81.74) v1(101.05,81.08) v1(101.05,80.42) v1(101.05,79.76) v1(101.6,62.91) v1(101.6,62.25) v1(101.63,72.42) v1(101.63,71.76) v1(101.63,71.1) v1(101.63,70.44) v1(101.63,69.78) v1(101.82,82.4) v1(101.82,81.74) v1(101.82,81.08) v1(101.82,80.42) v1(101.82,79.76) v1(102.34,72.42) v1(102.34,71.76) v1(102.34,71.1) v1(102.34,70.44) v1(102.34,69.78) v1(102.32,62.91) v1(102.53,82.4) v1(102.53,81.74) v1(102.53,81.08) v1(102.53,80.42) v1(102.53,79.76) v1(107.83,78.28) v1(107.83,67.92) v1(107.83,58.47) v2(94.3,82.35) v2(94.3,81.48) v2(94.3,80.62) v2(94.3,79.76) v2(94.27,72.49) v2(94.27,71.58) v2(94.27,70.61) v2(94.3,69.75) v2(94.3,62.89) v2(94.3,62.03) v2(94.3,61.16) v2(94.3,60.3) v2(99.07,82.3) v2(99.07,81.48) v2(99.1,80.62) v2(99.1,79.76) v2(99.1,72.49) v2(99.1,71.58) v2(99.1,70.61) v2(99.1,69.75) v2(99.07,62.84) v2(99.07,62.03) v2(99.1,61.16) v2(99.1,60.3)
VBUS:
  vias: v1(31.25,88.54) v1(31.66,87.93) v1(31.71,89.2) v1(32,88.54) v1(32.39,89.2) v1(32.39,87.93) v1(32.67,88.54) v1(33.03,89.2) v1(33.08,87.93) v1(33.38,88.54) v1(33.76,89.2) v1(34.07,88.54) v1(34.53,89.2) v1(38.45,97.67) v1(38.44,92.4) v1(39.31,89.36) v1(39.31,88.65) v1(39.99,89.36) v1(39.97,88.65) v1(40.63,89.31) v1(40.63,88.65) v1(41.29,89.31) v1(41.34,88.65) v1(42.35,90.07) v1(64.78,86.68) v1(72.83,93.27)
+CAP: length 3.4
  Top Layer w0.254: 60.9,76.07 60.5,76.07 60.16,76.41 58.93,76.41 58.68,76.67 58.68,76.96 58.56,77.08 58.56,77.51
CAP1_VOL:
  vias: v1(102.6,50.49) v1(107.83,61.28)
CAP2_VOL:
  vias: v1(107.83,70.63) v1(109.21,63.6) v4(100.75,50.04)
CAP3_VOL:
  vias: v1(101.38,49.53) v1(107.83,80.12) v1(109.84,62.79)
CC1:
  vias: v1(34.86,87.12) v1(38.32,87.78)
CUR_OUT:
  vias: v1(38.24,72.34) v1(41.87,72.34)
MOS_D1:
  vias: v1(101.99,52.53) v1(109.77,61.87)
MOS_SW1:
  vias: v1(30.67,59.59) v1(36.64,59.49)
PWR_CUR_DAC:
  vias: v1(39.13,73.1) v1(41.87,73.1) v1(49.44,83.77) v1(49.44,81.89) v1(49.44,79.76)
PWR_EN:
  vias: v1(37.43,71.68) v1(42.35,71.68) v1(78.04,70.21) v1(79.64,76.61)
PWR_VOL_DAC:
  vias: v1(59.35,83.97) v1(62.9,88.59)
SHORT_EN1:
  vias: v1(30.85,58.52) v1(36.03,58.42) v1(61.51,55.12) v1(63.39,55.73)
USB_DM:
  vias: v1(35.37,86) v1(37.22,87.07)
$1N37952: length 2.7
  Top Layer w0.254: 59.21,77.51 59.21,77.08 59.09,76.96 59.09,76.83 59.1,76.82 60.16,76.82 60.5,77.16 C13.2
  vias: v1(65.54,79.35) v1(67.5,94.18)
$1N40963:
  vias: v1(59.5,83.06) v1(63.54,92.61)

## Copper pours and planes (outline as drawn; the poured copper is in the pictures)
3V3 on Top Layer: 42.76,79.1 43.98,79.1 43.98,77.32 45.46,75.84 48.99,75.84 49.34,75.49 49.34,74.07 48.98,73.71 42.02,73.71 41.49,74.24 41.49,76.4 42.76,77.67
+12V on Top Layer: 62.01,70.21 62.01,66.5 62.42,66.09 63.59,66.09 64.61,67.11 64.61,69.98 64.39,70.21
+12V on Top Layer: 30.24,56.65 30.25,56.76 30.3,56.89 30.38,57 30.5,57.09 30.63,57.14 30.74,57.15 31.31,57.15 31.41,57.14 31.55,57.09 31.66,57 31.74,56.89 31.79,56.76 31.81,56.65 31.81,55.98 31.79,55.88 31.74,55.74 31.66,55.63 31.55,55.55 31.41,55.5 31.31,55.48 30.74,55.48 30.63,55.5 30.5,55.55 30.38,55.63 30.3,55.74 30.25,55.88 30.24,55.98
+12V on Top Layer: 58.22,67.59 57.51,66.88 52.82,66.88 52.07,66.13 52.07,65.33 52.53,64.87 58.81,64.87 59.93,65.99 63.28,65.99 63.38,66.09 63.38,67.58 63.38,67.59
+12V on Bottom Layer: 45.96,65.78 45.97,65.95 46.03,66.15 46.12,66.33 46.25,66.48 46.41,66.61 46.59,66.7 46.78,66.76 46.96,66.78 53.23,66.78 53.4,66.76 53.6,66.7 53.78,66.61 53.93,66.48 54.06,66.33 54.16,66.15 54.21,65.95 54.23,65.78 54.23,59.39 54.21,59.22 54.16,59.02 54.06,58.84 53.93,58.69 53.78,58.56 53.6,58.46 53.4,58.41 53.23,58.39 46.96,58.39 46.78,58.41 46.59,58.46 46.41,58.56 46.25,58.69 46.12,58.84 46.03,59.02 45.97,59.22 45.96,59.39
GND on Top Layer: 93.74,81.8 93.75,81.98 93.81,82.17 93.9,82.35 94.03,82.51 94.19,82.64 94.37,82.73 94.56,82.79 94.74,82.8 103.28,82.8 103.46,82.79 103.65,82.73 103.83,82.64 103.99,82.51 104.11,82.35 104.21,82.17 104.26,81.98 104.28,81.8 104.28,80.3 104.26,80.12 104.21,79.93 104.11,79.75 103.99,79.59 103.83,79.46 103.65,79.37 103.46,79.31 103.28,79.3 94.74,79.3 94.56,79.31 94.37,79.37 94.19,79.46 94.03,79.59 93.9,79.75 93.81,79.93 93.75,80.12 93.74,80.3
GND on Top Layer: 29.25,84.58 29.25,81.2 30.7,79.76 32.78,79.76 32.93,79.91 32.93,84.4 32.8,84.53 29.3,84.53
GND on Top Layer: 31.43,96.28 31.45,96.46 31.5,96.65 31.6,96.83 31.72,96.99 31.88,97.12 32.06,97.21 32.26,97.27 32.43,97.28 40.08,97.28 40.26,97.27 40.45,97.21 40.63,97.12 40.79,96.99 40.92,96.83 41.01,96.65 41.07,96.46 41.08,96.28 41.08,94.17 41.07,93.99 41.01,93.8 40.92,93.62 40.79,93.46 40.63,93.33 40.45,93.24 40.26,93.18 40.08,93.17 32.43,93.17 32.26,93.18 32.06,93.24 31.88,93.33 31.72,93.46 31.6,93.62 31.5,93.8 31.45,93.99 31.43,94.17
GND on Top Layer: 40.1,91.57 40.1,90.06 40.19,89.97 41.41,89.97 43.94,92.49 43.94,93.59 43.85,93.67 42.38,93.67 42.02,94.03 42.02,96.67 41.92,96.77 40.3,96.77 40.09,96.57 40.09,91.58
GND on Top Layer: 44.84,80.72 46.72,80.72 47.33,80.11 47.33,76.25 47.23,76.15 45.77,76.15 44.26,77.66 44.26,80.14
GND on Top Layer: 68.64,63.78 70.88,63.78 71.14,63.53 71.14,60.58 70.17,59.61 70.17,58.52 69.91,58.27 69.02,58.27 68.69,58.6 68.69,63.72
GND on Top Layer: 14.79,77.99 14.81,78.09 14.86,78.23 14.94,78.34 15.06,78.42 15.19,78.47 15.29,78.49 17.19,78.49 17.3,78.47 17.43,78.42 17.54,78.34 17.63,78.23 17.68,78.09 17.69,77.99 17.69,57.04 17.68,56.93 17.63,56.8 17.54,56.69 17.43,56.6 17.3,56.55 17.19,56.54 15.29,56.54 15.19,56.55 15.06,56.6 14.94,56.69 14.86,56.8 14.81,56.93 14.79,57.04
GND on Top Layer: 93.03,62.3 93.04,62.47 93.1,62.67 93.19,62.85 93.32,63 93.48,63.13 93.66,63.23 93.85,63.28 94.03,63.3 102.69,63.3 102.87,63.28 103.07,63.23 103.25,63.13 103.4,63 103.53,62.85 103.62,62.67 103.68,62.47 103.69,62.3 103.69,60.89 103.68,60.72 103.62,60.52 103.53,60.34 103.4,60.19 103.25,60.06 103.07,59.96 102.87,59.91 102.69,59.89 94.03,59.89 93.85,59.91 93.66,59.96 93.48,60.06 93.32,60.19 93.19,60.34 93.1,60.52 93.04,60.72 93.03,60.89
GND on Top Layer: 73.77,81.53 73.77,79.63 73.49,79.35 66.37,79.35 64.93,80.79 60.07,80.79 60.07,83.7 60.99,84.62 67.9,84.62 68.23,84.96 68.23,93.33 70,95.1 73.42,95.1 73.42,93.99 72.96,93.54 72.96,90.93 72.17,90.14 71.1,90.14 71.1,85.13 70.4,84.43 70.4,81.81 70.67,81.53
GND on Top Layer: 65.36,63.02 62.22,63.02 62.19,62.99 62.19,61.57 62.55,61.21 66.33,61.21 66.33,62.99 66.28,63.04 65.38,63.04
GND on Top Layer: 31.89,97.18 33.29,97.18 34.2,96.27 34.2,90.09 33.92,89.81 31.79,89.81 29.53,92.07 29.53,94.82
GND on Top Layer: 43.42,68.49 43.44,68.67 43.49,68.87 43.59,69.04 43.71,69.2 43.87,69.33 44.05,69.42 44.24,69.48 44.42,69.49 55.91,69.49 56.08,69.48 56.28,69.42 56.46,69.33 56.61,69.2 56.74,69.04 56.84,68.87 56.89,68.67 56.91,68.49 56.91,56.78 56.89,56.6 56.84,56.41 56.74,56.23 56.61,56.07 56.46,55.94 56.28,55.85 56.08,55.79 55.91,55.78 44.42,55.78 44.24,55.79 44.05,55.85 43.87,55.94 43.71,56.07 43.59,56.23 43.49,56.41 43.44,56.6 43.42,56.78
GND on Top Layer: 82.84,58.52 89.9,58.52 90.54,59.16 92.5,59.16 92.52,59.18 92.52,57.33 92.85,57 103.47,57 104.46,58.27 106.21,58.27 106.92,57.56 106.92,56.18 103.87,53.14 101.46,53.14 101,52.68 83.25,52.68 82.84,53.09 82.84,58.52
GND on Top Layer: 36.94,57.82 36.95,57.92 37,58.06 37.09,58.17 37.2,58.26 37.34,58.31 37.44,58.32 38.96,58.32 39.06,58.31 39.2,58.26 39.31,58.17 39.4,58.06 39.45,57.92 39.46,57.82 39.46,55.26 39.45,55.16 39.4,55.02 39.31,54.91 39.2,54.82 39.06,54.77 38.96,54.76 37.44,54.76 37.34,54.77 37.2,54.82 37.09,54.91 37,55.02 36.95,55.16 36.94,55.26
GND on Top Layer: 61.23,59.81 61.86,59.81 61.86,57.68 61.94,57.61 62.77,57.61 63.17,57.2 63.17,56.79 61.96,56.79 61.15,55.98 61.15,55.42 59.73,55.42 59.73,57.45 59.88,57.61 61.05,57.61 61.15,57.71 61.15,59.73
GND on Top Layer: 63.38,65.79 63.38,63.86 63.38,63.86 63.99,63.86 64.35,64.21 65.39,64.21 65.49,64.11 65.49,61.37 65.65,61.21 66.33,61.21 66.71,61.59 66.71,64.82 67.01,65.12 67.01,65.74 66.92,65.84 63.43,65.84
GND on Top Layer: 93.59,71.85 93.6,72.02 93.66,72.22 93.75,72.4 93.88,72.55 94.04,72.68 94.21,72.78 94.41,72.83 94.59,72.85 102.75,72.85 102.92,72.83 103.12,72.78 103.3,72.68 103.45,72.55 103.58,72.4 103.67,72.22 103.73,72.02 103.75,71.85 103.75,70.44 103.73,70.27 103.67,70.07 103.58,69.89 103.45,69.74 103.3,69.61 103.12,69.51 102.92,69.46 102.75,69.44 94.59,69.44 94.41,69.46 94.21,69.51 94.04,69.61 93.88,69.74 93.75,69.89 93.66,70.07 93.6,70.27 93.59,70.44
VBUS on Top Layer: 60.62,87.38 64.68,87.38 65.04,87.02 67.7,87.02 67.96,86.77 67.96,85.32 67.52,84.89 60.62,84.89
VBUS on Top Layer: 39.25,91.54 39.83,91.54 39.83,89.9 40.12,89.61 40.88,89.61 41.13,89.86 41.59,89.86 43.58,91.85 47.15,91.85 49.8,89.2 58.25,89.2 59.68,87.78 61.15,87.78 61.15,84.81 47.69,84.81 47.61,84.73 46.16,86.18 46.16,89.71 45.86,90.02 43.89,90.02 43.55,89.67 43.55,89.12 42.77,88.34 39.18,88.34 38.85,88.67 38.85,89.48 39.25,89.89
VBUS on Top Layer: 34.38,90.32 34.96,90.32 34.96,88.82 34.99,88.8 33.46,87.27 33.39,87.27 33.39,86.07 32.92,85.6 29.85,85.6 29.76,85.5 29.76,88.16 31.2,89.61 34.02,89.61 34.38,89.97
VBUS on Bottom Layer: 30.75,89.81 30.75,87.91 31.03,87.63 34.4,87.63 34.51,87.73 34.53,87.73 35.05,88.25 42.2,88.25 42.64,88.7 42.64,90.18 42.51,90.32 31.25,90.32
+CAP on Top Layer: 75.88,59.5 78.74,59.5 81.27,62.03 82.71,62.03 82.71,58.94 81.67,57.9 75.88,57.9
+CAP on Top Layer: 83.15,77.38 90.94,77.38 90.94,74.66 83.15,74.66
+CAP on Top Layer: 82.46,86.66 89.18,86.66 89.18,84.64 88.81,84.28 84.65,84.28 84.31,83.94 84.31,76.71 81.9,76.71 81.8,76.81 81.8,86
+CAP on Top Layer: 65.11,75.89 81.39,75.89 81.39,71.07 81.09,70.76 76.24,70.76 76.19,70.81 75.86,70.81 74.89,71.78 60.34,71.78 60.34,74.3 64.83,74.3 65.11,74.57
+CAP on Top Layer: 80.76,77.11 83.73,77.11 83.73,60.1 80.76,60.1
CAP1 on Top Layer: 90.46,68.18 92.32,68.18 92.32,66.28 92.61,65.99 103.62,65.99 105.04,67.41 106.67,67.41 108.67,65.4 108.67,63.09 103.95,63.09 103.54,63.5 90.46,63.5
CAP2 on Top Layer: 91.01,77.99 92.68,77.99 92.68,76.34 93.18,75.84 104.08,75.84 105.09,76.86 106.64,76.86 108.65,74.85 108.65,72.59 103.8,72.59 103.41,73.07 90.8,73.07 90.8,74.25 91.27,74.73 91.27,76.58 91.01,76.84
CAP3 on Top Layer: 89.62,86.36 89.62,83.59 93.31,83.59 93.31,86.36
CAP3 on Top Layer: 91.3,85.19 91.3,83.26 91.45,83.11 103.82,83.11 105.15,82.13 106.24,82.13 108.55,82.14 108.55,84.63 106.76,86.41 95.57,86.41 94.35,85.19
WORK+ on Top Layer: 71.74,63.35 73.89,63.35 73.89,61.36 71.74,61.36
WORK+ on Top Layer: 71.74,62.23 75.02,62.23 75.32,61.92 78.02,61.92 78.32,61.62 78.32,59.82 78.24,59.74 71.94,59.74 71.74,59.94
$1N2189 on Top Layer: 67.32,70.66 70.32,70.66 70.49,70.49 70.49,67.7 70.14,67.36 67.53,67.36 65.39,65.23 64.33,65.23 64.33,66.25 66.26,68.17 66.26,69.6
$1N2240 on Top Layer: 72.02,64.82 73.57,64.82 73.57,63.46 72.02,63.46
$1N2253 on Top Layer: 71.3,87.44 71.31,87.44 71.31,86.56 73.37,86.56 74.59,85.34 79.79,85.34 80.25,85.8 80.25,88.16 80.07,88.34 74.59,88.34 73.67,87.43 73.65,87.44
$1N17016 on Top Layer: 92.88,59.55 103.49,59.55 103.49,57.35 92.88,57.35
$1N17478 on Top Layer: 92.79,69.2 103.67,69.2 103.67,66.73 103.49,66.55 92.79,66.55
$1N17851 on Top Layer: 92.92,78.96 103.95,78.96 103.95,76.5 92.92,76.5
$1N37952 on Top Layer: 61.48,80.62 61.48,78.82 61.51,78.79 64.79,78.79 65.03,78.56 65.03,78.26 65.42,77.88 65.42,77.63 66.68,76.36 67.64,76.36 67.93,76.66 67.93,79.2 66.3,79.2 64.88,80.62
$1N37952 on Top Layer: 79.62,82.45 80.63,81.43 80.63,79.15 77.69,76.2 66.48,76.2 66.43,76.25 66.43,78.29 66.68,78.54 73.93,78.54 73.98,78.59 73.98,80.72 75.71,82.45
$1N41094 on Top Layer: 22.31,83.21 22.47,83.06 27.14,83.06 27.19,83.11 27.19,86.21 30.83,89.85 30.83,90.28 29.97,91.13 27.67,91.13 26.4,89.86 22.31,89.86
$1N41094 on Top Layer: 22.11,86.05 27.39,86.05 28.82,84.63 28.99,84.63 28.99,81.05 30.59,79.45 32.47,79.45 35.14,76.78 35.14,74.02 33.77,72.64 28.36,72.64 27.8,73.2 27.8,77.47 26.94,78.33 22.87,78.33 22.11,79.1
$1N41220 on Top Layer: 67.16,64.92 68.29,64.92 68.74,65.38 70.94,65.38 71.56,65.99 71.56,66.45 72.27,67.17 72.27,70.31 72.63,70.66 74.18,70.66 74.28,70.56 74.28,64.54 73.89,64.16 67.28,64.16 67.16,64.28

## Text on the board
Bottom Silkscreen Layer: 填锡孔 | 蜗牛台点焊机V1.1
Document Layer: 8*8的方块用来打二维码的， / 如不需要可自行删除 | 版本变动 / V1.0 初版 / V1.1 / 将CH224k的1k电阻从0603更换成了1206 / 修复TypeC引脚的错误
Top Silkscreen Layer: 关 / 开 | 独立控制器 | 信号发生器 | 示波器 | GND | C3+ | C2+ | C1+ | 采集 | 触发 | 从机模式口 | PD充电 | 调流 | 外接电 / 源充电口 | + | - | 电流检测 | 12V升压 | 均衡充电 | 主机模式口 | S G D
